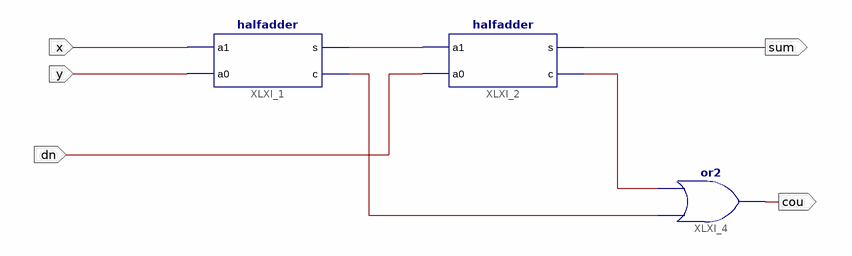
[diagram p0: schematic sheet 1]
// Xilinx ISE schematic full.sch (spartan3) as structural Verilog: 3 symbols, 5 ports
module full (
  input  dn,
  input  y,
  input  x,
  output sum,
  output cou
);

  wire XLXN_1, XLXN_3, XLXN_10;

  halfadder XLXI_1 (.a0(y), .a1(x), .c(XLXN_3), .s(XLXN_1));
  halfadder XLXI_2 (.a0(dn), .a1(XLXN_1), .c(XLXN_10), .s(sum));
  or XLXI_4 (cou, XLXN_3, XLXN_10);
endmodule
